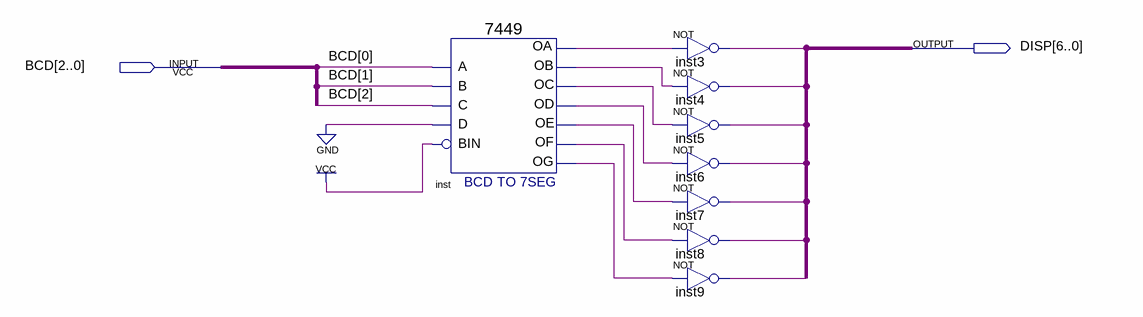
[diagram p0: schematic sheet]
// Quartus schematic 7seg.bdf as structural Verilog: 8 symbols, 2 pins
module \7seg  (
  input  [2:0] BCD,
  output [6:0] DISP
);

  wire inst3_out, inst4_out, inst5_out, inst6_out, inst7_out, inst8_out, inst9_out, inst_oa, inst_ob,
       inst_oc, inst_od, inst_oe, inst_of, inst_og;

  \7449  inst (
    .A(BCD[0]), .C(BCD[2]), .B(BCD[1]), .D(1'b0), .BIN(1'b1), .OC(inst_oc), .OD(inst_od), .OF(inst_of),
    .OG(inst_og), .OB(inst_ob), .OA(inst_oa), .OE(inst_oe));
  not inst3 (inst3_out, inst_oa);
  not inst4 (inst4_out, inst_ob);
  not inst5 (inst5_out, inst_oc);
  not inst6 (inst6_out, inst_od);
  not inst7 (inst7_out, inst_oe);
  not inst8 (inst8_out, inst_of);
  not inst9 (inst9_out, inst_og);
endmodule
